# EasyEDA Pro project 物联网底板.eprj, board PCB1
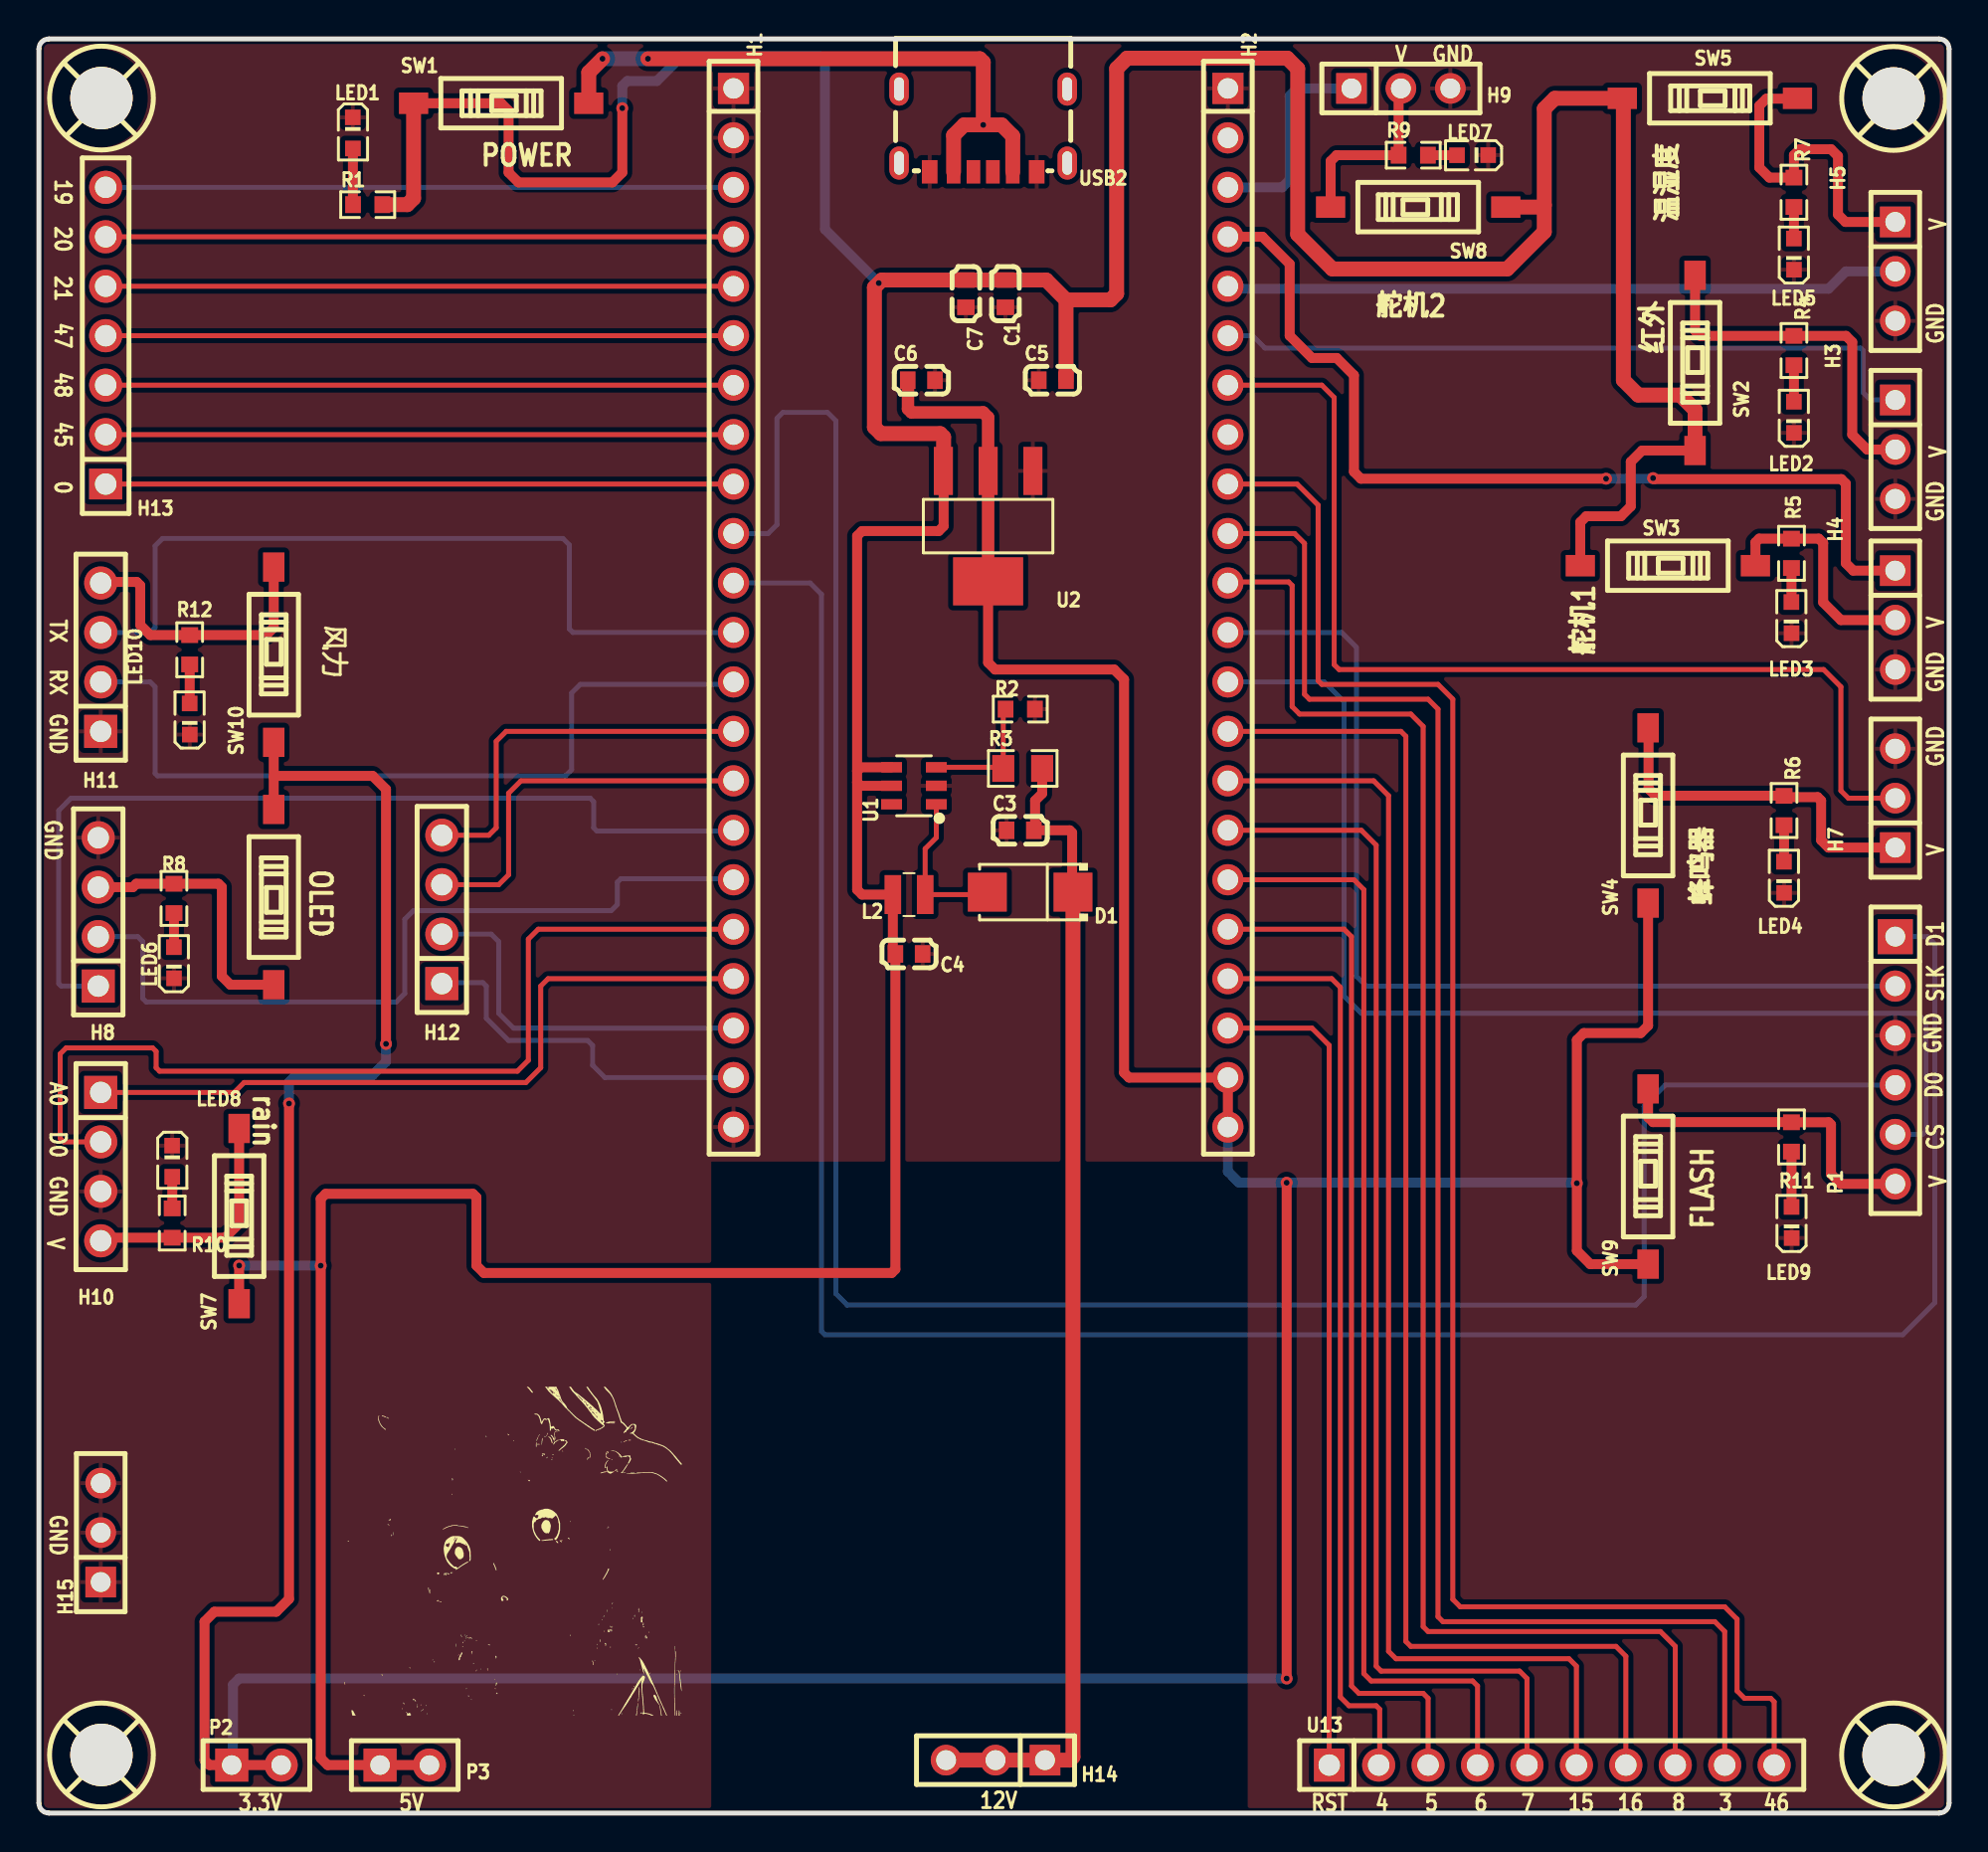
[diagram p2: board, top side]
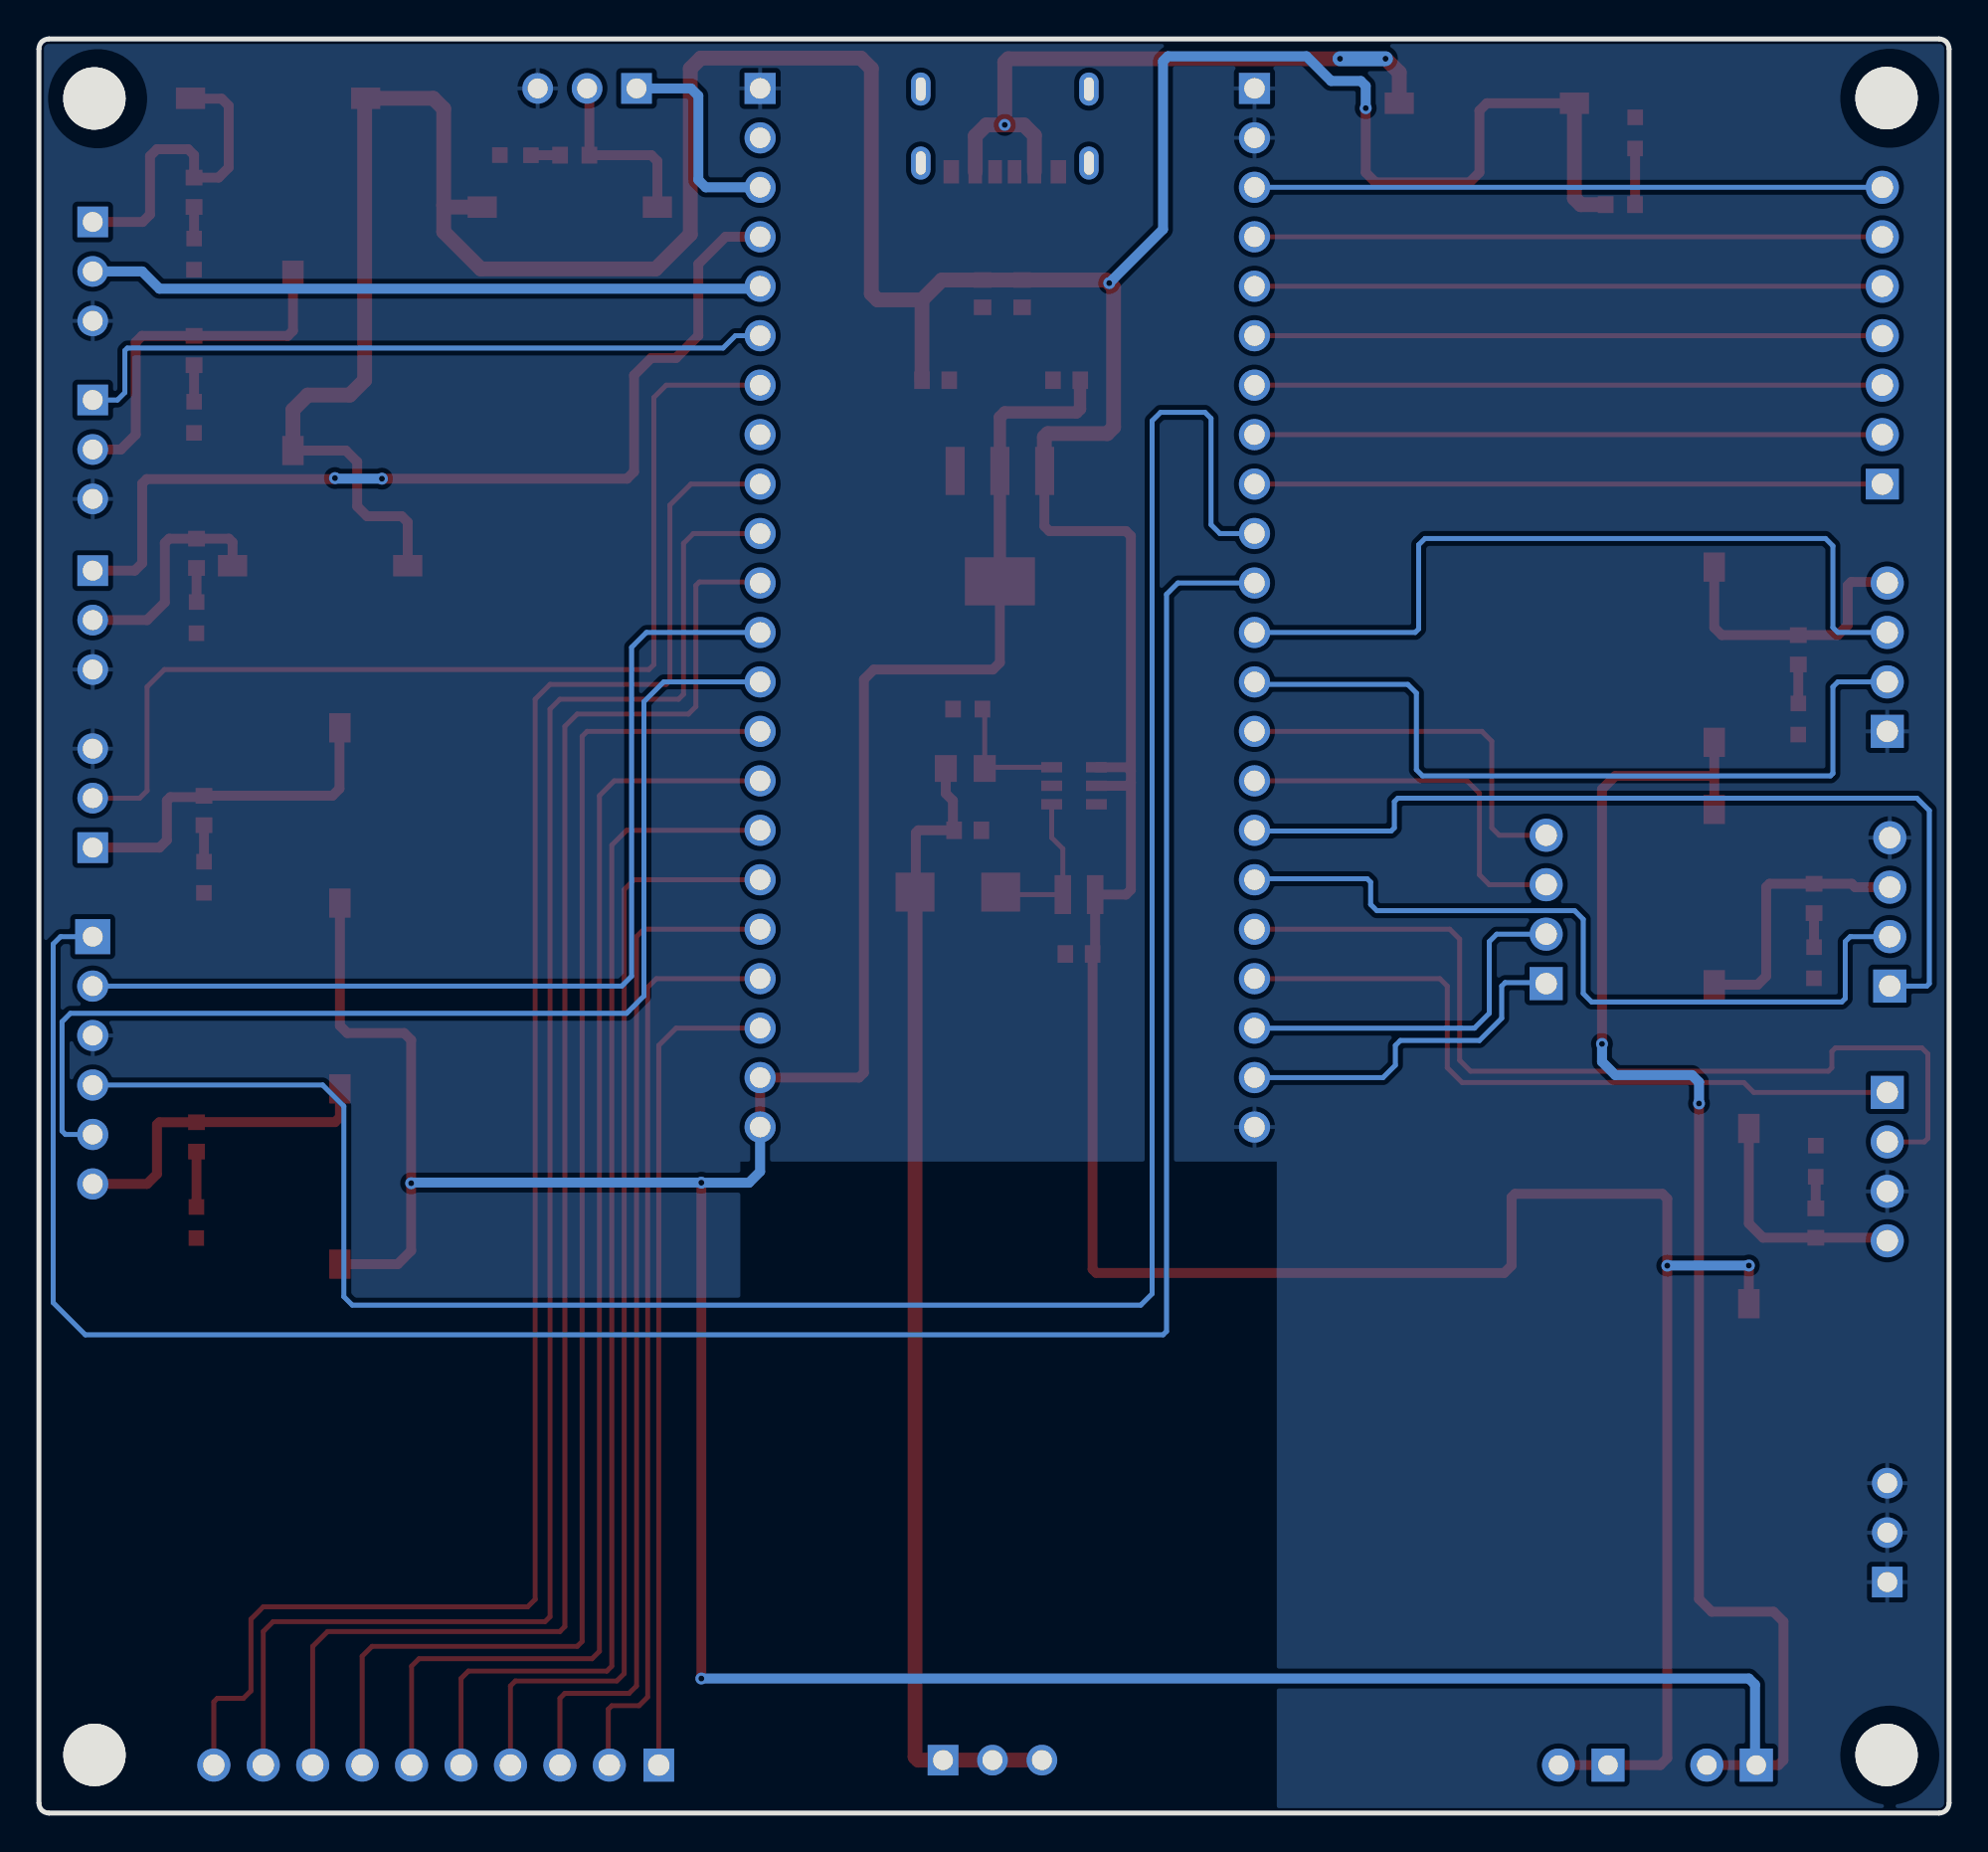
[diagram p3: board, bottom side, seen from below]

Outline 98.14 x 91.11 mm; copper layers: Top Layer, Bottom Layer. Coordinates in mm from the lower left corner of the outline.
Outline path: 0,90.6 0,0.51 arc(0.15,0.15) 0.51,0 97.63,0 arc(97.99,0.15) 98.14,0.51 98.14,90.6 arc(97.99,90.96) 97.63,91.11 0.51,91.11 arc(0.15,90.96) 0,90.6
Stack: Top Layer 0.035mm / Dielectric1 1.51mm FR4 er 4.5 / Bottom Layer 0.035mm

## Design rules (mm)
net D0_F: DP2
net D1_F: DP2
net TX: DP1
net RX: DP1
template: JLCPCB Capability(Two Layers Board)
spacing copperThickness1oz (default): track to track 0.102, other pairs 0.152 to 0.3
spacing copperThickness2oz: track to track 0.203, other pairs 0.152 to 0.3
track width copperThickness1oz (default): min 0.127, default 0.254, max 2.54
track width copperThickness2oz: min 0.203, default 0.254, max 2.54
differential pair differentialPair (default): width min 0.127, default 0.254, max 2.54; gap min 0.152, default 0.152
via viaSize (default): diameter min 0.5, default 0.61, max 10; hole min 0.3, default 0.305, max 6.3

## Placement (name value [footprint] x y rotation side)
C1  100nF  [C0603]  49.66 78.03 90 top
C3  22uF  [C0603]  50.42 50.47 0 top
C4  22uF  [C0603]  44.7 44.12 180 top
C5  10uF  [C0603]  52.07 73.58 0 top
C6  10uF  [C0603]  45.34 73.58 0 top
C7  22uF  [C0603]  47.63 78.03 90 top
D1  SS34  [SMA_L4.3-W2.6-LS5.2-RD]  50.93 47.3 180 top
H1  CS-1165SDIG-1*22  [HDR-TH_22P-P2.54-V-F]  35.69 61.9 270 top
H2  CS-1165SDIG-1*22  [HDR-TH_22P-P2.54-V-F]  61.09 61.9 270 top
H2#2  -  [M3]  3.05 88.06 0 top
H2#3  -  [M3]  95.13 88.04 0 top
H2#4  -  [M3]  95.12 2.97 0 top
H2#5  -  [M3]  3.05 2.97 0 top
H3  红外  [HDR-TH_3P-P2.54-V-F]  95.38 70.03 270 top
H4  舵机  [HDR-TH_3P-P2.54-V-F]  95.38 61.27 270 top
H5  DHT11  [HDR-TH_3P-P2.54-V-F]  95.38 79.17 270 top
H7  蜂鸣器  [HDR-TH_3P-P2.54-V-F]  95.38 52.12 90 top
H8  OLED  [HDR-TH_4P-P2.54-V-F]  3.05 46.28 90 top
H9  舵机2  [HDR-TH_3P-P2.54-V-F]  69.98 88.57 0 top
H10  rain  [HDR-TH_4P-P2.54-V-F]  3.18 33.2 270 top
H11  WIND  [HDR-TH_4P-P2.54-V-F]  3.18 59.36 90 top
H12  2.54-1*4P母  [HDR-TH_4P-P2.54-V-F]  20.7 46.41 90 top
H13  PM254V-11-07-H85  [HDR-TH_7P-P2.54-V-F]  3.43 75.87 90 top
H14  PM254V-11-03-H85  [HDR-TH_3P-P2.54-V-F]  49.15 2.72 180 top
H15  PM254V-11-03-H85  [HDR-TH_3P-P2.54-V-F]  3.18 14.4 90 top
L2  4.7uH  [IND-SMD_L2.5-W2.0-VLS252012CX-150M]  44.7 47.17 180 top
LED1  XL-1608UGC-04  [LED0603-RD_GREEN]  16.13 86.28 270 top
LED2  XL-1608UGC-04  [LED0603-RD_GREEN]  90.17 71.68 90 top
LED3  XL-1608UGC-04  [LED0603-RD_GREEN]  90.04 61.39 90 top
LED4  XL-1608UGC-04  [LED0603-RD_GREEN]  89.66 48.06 90 top
LED5  XL-1608UGC-04  [LED0603-RD_GREEN]  90.17 80.06 90 top
LED6  XL-1608UGC-04  [LED0603-RD_GREEN]  6.94 43.67 90 top
LED7  XL-1608UGC-04  [LED0603-RD_GREEN]  73.66 85.14 180 top
LED8  XL-1608UGC-04  [LED0603-RD_GREEN]  6.85 33.48 270 top
LED9  XL-1608UGC-04  [LED0603-RD_GREEN]  90.05 30.33 90 top
LED10  XL-1608UGC-04  [LED0603-RD_GREEN]  7.75 56.19 90 top
P1  FLASH  [HDR-TH_6P-P2.54-V-F]  95.38 38.66 270 top
P2  2.54-1*2P母  [HDR-TH_2P-P2.54-V-F]  11.18 2.46 0 top
P3  2.54-1*2P母  [HDR-TH_2P-P2.54-V-F]  18.8 2.46 0 top
R1  1kΩ  [R0603]  16.89 82.6 0 top
R2  1kΩ  [R0603]  50.42 56.69 180 top
R3  19kΩ  [R0805]  50.55 53.65 0 top
R4  1kΩ  [R0603]  90.17 75.11 270 top
R5  1kΩ  [R0603]  90.04 64.69 270 top
R6  1kΩ  [R0603]  89.66 51.49 270 top
R7  1kΩ  [R0603]  90.17 83.24 270 top
R8  1kΩ  [R0603]  6.94 46.97 270 top
R9  1kΩ  [R0603]  70.61 85.14 0 top
R10  1kΩ  [R0603]  6.85 30.3 90 top
R11  1kΩ  [R0603]  90.04 34.72 90 top
R12  1kΩ  [R0603]  7.75 59.74 270 top
SW1  DSIC01LS-P  [SW-SMD_2P-L3.5-W6.1-P2.54-LS9.8]  23.75 87.81 0 top
SW2  DSIC01LS-P  [SW-SMD_2P-L3.5-W6.1-P2.54-LS9.8]  85.09 74.47 90 top
SW3  DSIC01LS-P  [SW-SMD_2P-L3.5-W6.1-P2.54-LS9.8]  83.69 64.06 0 top
SW4  DSIC01LS-P  [SW-SMD_2P-L3.5-W6.1-P2.54-LS9.8]  82.68 51.23 90 top
SW5  DSIC01LS-P  [SW-SMD_2P-L3.5-W6.1-P2.54-LS9.8]  85.85 88.06 0 top
SW6  DSIC01LS-P  [SW-SMD_2P-L3.5-W6.1-P2.54-LS9.8]  12.07 47.04 270 top
SW7  DSIC01LS-P  [SW-SMD_2P-L3.5-W6.1-P2.54-LS9.8]  10.29 30.66 90 top
SW8  DSIC01LS-P  [SW-SMD_2P-L3.5-W6.1-P2.54-LS9.8]  70.87 82.47 180 top
SW9  DSIC01LS-P  [SW-SMD_2P-L3.5-W6.1-P2.54-LS9.8]  82.68 32.69 90 top
SW10  DSIC01LS-P  [SW-SMD_2P-L3.5-W6.1-P2.54-LS9.8]  12.07 59.49 90 top
U1  MT3608  [SOT-23-6_L2.9-W1.6-P0.95-LS2.8-BL]  44.96 52.76 90 top
U2  AMS1117-3.3V  [SOT-223-4_L6.5-W3.5-P2.30-LS7.0-TR]  48.77 66.09 180 top
U13  PM254-1-10-Z-8.5  [HDR-TH_10P-P2.54-V-F]  77.72 2.46 0 top
USB2  TYPE-C 6P(073)  [TYPE-C-SMD_TYPE-C-6P-073]  48.51 86.41 180 top

## Footprints (pads in the part's own frame, mm; a bottom-side part is the same pattern mirrored in y, then rotated)
C0603
  rect 0.8x0.9 smd: 1(-0.7,0) 2(0.7,0)
HDR-TH_2P-P2.54-V-F
  rect 1.7x1.7 hole 1: 1(-1.27,0)
  round 1.7 hole 1: 2(1.27,0)
HDR-TH_3P-P2.54-V-F
  rect 1.575x1.575 hole 1.02: 1(-2.54,0)
  round 1.575 hole 1.02: 2(0,0) 3(2.54,0)
HDR-TH_4P-P2.54-V-F
  rect 1.7x1.7 hole 1.1: 1(-3.81,0)
  round 1.7 hole 1.1: 2(-1.27,0) 3(1.27,0) 4(3.81,0)
HDR-TH_6P-P2.54-V-F
  rect 1.8x1.8 hole 1.02: 1(-6.35,0)
  round 1.6 hole 1.02: 2(-3.81,0) 3(-1.27,0) 4(1.27,0) 5(3.81,0) 6(6.35,0)
HDR-TH_7P-P2.54-V-F
  rect 1.575x1.7 hole 1.1: 1(-7.62,0)
  round 1.7 hole 1.1: 2(-5.08,0) 3(-2.54,0) 4(0,0) 5(2.54,0) 6(5.08,0) 7(7.62,0)
HDR-TH_10P-P2.54-V-F
  rect 1.575x1.7 hole 1.1: 1(-11.43,0)
  round 1.7 hole 1.1: 2(-8.89,0) 3(-6.35,0) 4(-3.81,0) 5(-1.27,0) 6(1.27,0) 7(3.81,0) 8(6.35,0) 9(8.89,0) 10(11.43,0)
HDR-TH_22P-P2.54-V-F
  rect 1.6x1.6 hole 1.05: 1(-26.67,0)
  round 1.6 hole 1.05: 2(-24.13,0) 3(-21.59,0) 4(-19.05,0) 5(-16.51,0) 6(-13.97,0) 7(-11.43,0) 8(-8.89,0) 9(-6.35,0) 10(-3.81,0) 11(-1.27,0) 12(1.27,0) 13(3.81,0) 14(6.35,0) 15(8.89,0) 16(11.43,0) 17(13.97,0) 18(16.51,0) 19(19.05,0) 20(21.59,0) 21(24.13,0) 22(26.67,0)
IND-SMD_L2.5-W2.0-VLS252012CX-150M
  rect 0.85x2 smd: 1(-0.83,0) 2(0.83,0)
LED0603-RD_GREEN
  rect 0.8x0.8 smd: 1(-0.799,-0.004) 2(0.799,0.004)
M3
  round 3.2 hole 3.2: 0(0.165,0.013)
R0603
  rect 0.806x0.864 smd: 1(-0.753,0) 2(0.753,0)
R0805
  rect 1.133x1.377 smd: 1(-1,0) 2(1,0)
SMA_L4.3-W2.6-LS5.2-RD
  rect 2x2 smd: 1(-2.2,0) 2(2.2,0)
SOT-23-6_L2.9-W1.6-P0.95-LS2.8-BL
  rect 0.532x1.072 smd: 1(-0.95,-1.149) 2(0,-1.149) 3(0.95,-1.149) 4(0.95,1.149) 5(0,1.149) 6(-0.95,1.149)
SOT-223-4_L6.5-W3.5-P2.30-LS7.0-TR
  rect 0.98x2.47 smd: 1(-2.3,-2.835) 2(0,-2.835) 3(2.3,-2.835)
  rect 3.6x2.47 smd: 4(0,2.835)
SW-SMD_2P-L3.5-W6.1-P2.54-LS9.8
  rect 1.5x1.1 smd: 1(-4.5,0) 2(4.5,0)
TYPE-C-SMD_TYPE-C-6P-073
  oval 1x1.7 hole 0.5x1.2: 7(-4.32,1.675) 7(-4.32,-2.125) 7(4.32,1.675) 7(4.32,-2.125)
  rect 0.7x1.2 smd: A5(-0.5,2.125) A9(1.52,2.125) B5(0.5,2.125) B9(-1.52,2.125)
  rect 0.8x1.2 smd: A12(2.75,2.125) B12(-2.75,2.125)

## Nets
As in the schematic.

Pads without a net: H2 2; H2#2 0; H2#3 0; H2#4 0; H2#5 0; U1 6; USB2 7 A5 B5

## Via types
v1: diameter 0.61, hole 0.305, Top Layer to Bottom Layer, 14 vias

## Routing (per net, layer and track width the routed paths; a pad name or vN(x,y) marks a point on that pad's centre or on a via; arc(x,y) is an arc through that point)
3.3V: length 254.7
  Top Layer w0.508: 12.45,2.46 P2.1 8.76,2.46 8.51,2.72 8.51,9.83 9.02,10.34 12.19,10.34 12.85,11 v1(12.85,36.44) ; SW9.1 79.71,28.19 79.02,28.88 v1(79.02,32.35) 79.02,39.7 79.38,40.06 82.3,40.06 82.68,40.44 SW4.1 ; 12.06,53.2 12.13,53.26 17.15,53.26 17.83,52.58 v1(17.83,39.5) ; 12.06,53.2 12.06,54.99 ; 12.06,53.2 12.06,51.54 ; H2.22 H2.21 56.01,37.77 55.75,38.02 55.75,58.22 55.25,58.73 49.13,58.73 48.77,59.08 U2.4 ; v1(64.11,32.37) v1(64.11,6.91)
  Top Layer w0.635: C6.1 44.65,73.57 44.65,72.11 44.83,71.93 48.51,71.93 48.77,71.68 U2.2 U2.4
  Bottom Layer w0.508: H2.22 61.09,32.94 61.66,32.37 v1(64.11,32.37) 64.11,32.38 78.99,32.38 78.99,32.37 ; v1(12.85,36.44) 12.85,37.54 13.21,37.9 17.15,37.9 17.83,38.58 v1(17.83,39.5) ; v1(64.11,6.91) 10.29,6.91 9.97,6.59 9.97,2.53 P2.1
5V: length 32.6
  Top Layer w0.762: v1(28.96,90.09) 28.25,89.39 SW1.2 ; USB2.B9 50.03,86.12 49.46,86.7 v1(48.52,86.7) ; 46.99,84.29 46.99,86.16 47.53,86.7 v1(48.52,86.7) ; v1(31.29,90.09) 48.34,90.09 48.52,89.91 v1(48.52,86.7)
  Bottom Layer w0.762: v1(31.29,90.09) v1(28.96,90.09)
12V: length 59.4
  Top Layer w0.508: R3.2 51.55,52.36 51.18,51.99 51.18,50.53 C3.2 52.96,50.47 53.09,50.34 53.09,47.34 D1.1
  Top Layer w0.762: H14.3 H14.2 H14.1 52.96,2.72 53.13,2.89 D1.1
VIN: length 292.1
  Top Layer w0.508: v1(29.97,87.55) 29.97,84.25 29.46,83.74 24.64,83.74 24.13,84.25 24.13,87.43 23.75,87.81 SW1.1 ; 42.04,52.94 42.22,52.76 U1.5 ; 42.04,52.94 42.04,53.52 ; 42.04,52.94 42.04,47.42 42.29,47.17 43.87,47.17 43.87,44.38 ; 44.07,44.18 44.13,44.12 ; 42.04,53.52 42.23,53.71 U1.4 ; 42.04,53.52 42.04,65.58 42.29,65.84 46.23,65.84 46.48,66.09 46.48,68.91 U2.3 ; SW7.1 v1(10.29,28.12) ; SW2.1 82.37,69.97 81.79,69.39 81.79,67.11 81.28,66.6 79.5,66.6 79.19,66.29 SW3.1 ; P3.2 P3.1 14.84,2.46 14.48,2.82 v1(14.48,28.11) 14.48,31.55 14.73,31.8 22.3,31.8 22.48,31.62 22.48,28.12 22.86,27.74 43.82,27.74 44,27.93 C4.2
  Top Layer w0.762: 77.34,82.57 77.24,82.47 SW8.1 ; 77.34,82.57 77.34,87.52 77.88,88.06 SW5.1 81.41,88.01 81.41,73.58 82.17,72.82 84.33,72.82 85.09,72.06 SW2.1 ; 77.34,82.57 77.34,81.2 75.44,79.3 66.45,79.3 64.67,81.08 64.67,89.59 64.14,90.12 55.91,90.12 55.37,89.59 55.37,78.03 55.05,77.71 52.77,77.71 ; R1.2 18.92,82.6 19.25,82.93 SW1.1 ; C5.2 52.77,77.71 ; 52.77,77.71 51.75,78.73 C1.2 C7.2 43.31,78.73 42.93,78.35 42.93,71.17 43.25,70.84 46.3,70.84 46.48,70.66 46.48,68.94 U2.3
  Bottom Layer w0.508: v1(10.29,28.12) 14.47,28.12 v1(14.48,28.11) ; v1(29.97,87.55) 29.97,88.7 30.23,88.95 31.75,88.95 33.02,90.22 40.13,90.22 40.39,89.97 40.39,81.33 v1(43.15,78.57)
A0_RAIN: length 37.4
  Top Layer w0.254: H1.19 26.16,42.85 25.78,42.47 25.78,38.28 25.02,37.52 10.54,37.52 10.03,37.01 H10.1
BEEP: length 54.2
  Top Layer w0.254: H7.2 92.96,52.12 92.58,52.5 92.58,57.84 91.69,58.73 66.8,58.73 66.55,58.98 66.55,72.7 65.91,73.33 H2.7
CS_F: length 59.2
  Bottom Layer w0.254: P1.5 96.77,34.85 96.95,35.03 96.95,40.64 96.52,41.07 67.95,41.07 67.06,41.96 67.06,57.07 66.04,58.09 H2.13
D0_F: length 121.1
  Bottom Layer w0.254: P1.4 83.57,37.39 82.48,36.3 82.48,26.52 82.04,26.09 41.53,26.09 40.95,26.67 40.95,71.5 40.51,71.93 38.23,71.93 37.92,71.63 37.92,66.17 37.47,65.71 H1.10
D1_F: length 121.2
  Bottom Layer w0.254: H1.11 39.62,63.17 40.21,62.59 40.21,24.74 40.39,24.56 95.76,24.56 97.41,26.21 97.41,44.63 97.03,45.01 P1.1
DO_RAIN: length 48.9
  Top Layer w0.254: H10.2 1.27,34.47 1.09,34.65 1.09,38.99 1.4,39.29 5.84,39.29 6.02,39.11 6.02,38.28 6.2,38.1 24.59,38.1 25.15,38.66 25.15,44.88 25.65,45.39 H1.18
PWM_1: length 48.9
  Top Layer w0.508: v1(80.52,68.53) 67.92,68.53 67.56,68.89 67.56,73.84 66.67,74.73 65.41,74.73 64.26,75.87 64.26,79.55 62.86,80.95 H2.4 ; H4.1 93.22,63.81 92.84,64.19 92.84,68.27 92.61,68.5 82.98,68.5 v1(82.93,68.56)
  Bottom Layer w0.508: v1(80.52,68.53) 82.9,68.53 v1(82.93,68.56)
PWM_2: length 11
  Bottom Layer w0.508: H9.1 64.64,88.57 64.26,88.19 64.26,83.87 63.88,83.49 H2.3
RED_DATA: length 36.9
  Bottom Layer w0.254: H2.6 62.36,75.87 62.99,75.24 93.6,75.24 93.73,75.11 93.73,72.95 94.11,72.57 H3.1
RX: length 41.4
  Bottom Layer w0.254: H11.2 5.72,58.09 5.97,57.84 5.97,53.39 6.1,53.26 27.05,53.26 27.37,53.58 27.37,57.52 27.81,57.96 35.56,57.96 H1.13
SCK: length 41.3
  Bottom Layer w0.254: 3.05,45.01 5.08,45.01 5.33,44.76 5.33,41.83 5.51,41.65 18.36,41.65 18.8,42.09 18.8,45.9 19.24,46.34 29.4,46.34 29.72,46.66 29.72,47.8 29.9,47.98 35.63,47.98 H1.17
SDA: length 47.4
  Bottom Layer w0.254: H8.1 1.14,42.47 1.02,42.6 1.02,51.49 1.65,52.12 28.32,52.12 28.5,51.94 28.5,50.6 28.67,50.43 35.65,50.43 H1.16
SLK_F: length 51.7
  Bottom Layer w0.254: P1.2 68.2,42.47 67.69,42.98 67.69,59.87 66.93,60.63 H2.12
TEMP_DATA: length 34.7
  Bottom Layer w0.508: H5.2 92.84,79.17 91.95,78.28 61.21,78.28 H2.5
TX: length 41.5
  Bottom Layer w0.254: H11.3 5.72,60.63 5.97,60.88 5.97,65.08 6.35,65.46 26.92,65.46 27.25,65.13 27.25,60.81 27.43,60.63 H1.12
$1N2366: length 2.9
  Top Layer w0.508: LED1.2 16.13,82.61 R1.1
$1N3012: length 6.6
  Top Layer w0.254: U1.3 49.48,53.71 R3.1 49.55,56.57 R2.2
$1N3021: length 8.1
  Top Layer w0.254: U1.1 46.11,50.1 45.53,49.52 L2.1 48.6,47.17 D1.2
$1N5411: length 91.7
  Top Layer w0.254: H2.9 64.64,68.25 65.72,67.17 65.72,58.15 65.91,57.96 71.88,57.96 72.64,57.2 72.64,10.97 73.03,10.59 86.61,10.59 87.25,9.96 87.25,6.27 87.63,5.89 88.97,5.89 89.15,5.71 U13.10
$1N5418: length 87.6
  Top Layer w0.254: 86.61,2.46 86.61,9.32 86.11,9.83 72.14,9.83 71.88,10.08 71.88,56.69 71.37,57.2 65.28,57.2 65.02,57.46 65.02,65.2 64.52,65.71 H2.10
$1N5441: length 82.5
  Top Layer w0.254: H2.11 61.14,63.22 64.21,63.22 64.39,63.04 64.39,56.82 64.77,56.44 70.48,56.44 71.12,55.8 71.12,9.58 71.37,9.32 83.31,9.32 84.07,8.56 U13.8
$1N5447: length 72.9
  Top Layer w0.254: H2.14 69.98,55.55 70.23,55.3 70.23,8.81 70.48,8.56 81.03,8.56 81.53,8.05 U13.7
$1N5454: length 67.6
  Top Layer w0.254: U13.6 78.99,7.54 78.61,7.93 69.72,7.93 69.34,8.31 69.34,52.25 68.58,53.01 H2.15
$1N5462: length 62.6
  Top Layer w0.254: U13.5 76.45,6.91 76.07,7.29 68.96,7.29 68.71,7.54 68.71,49.71 67.95,50.47 H2.16
$1N5471: length 57.6
  Top Layer w0.254: H2.17 67.56,47.93 68.07,47.42 68.07,7.16 68.45,6.78 73.66,6.78 73.91,6.53 U13.4
$1N5478: length 52.6
  Top Layer w0.254: U13.3 71.37,5.89 71.12,6.15 67.82,6.15 67.44,6.53 67.44,45.01 67.06,45.39 H2.18
$1N5485: length 47.6
  Top Layer w0.254: H2.19 66.42,42.85 66.87,42.41 66.87,5.96 67.31,5.51 68.71,5.51 68.89,5.33 68.89,2.52 U13.2
$1N5495: length 42.5
  Top Layer w0.254: U13.1 66.29,39.42 65.41,40.31 H2.20
$1N5602: length 19.8
  Top Layer w0.254: H12.4 23.11,50.22 23.5,50.6 23.5,55.04 24,55.55 H1.14
$1N5611: length 19.7
  Top Layer w0.254: H12.3 23.62,47.68 24.13,48.18 24.13,52.38 24.77,53.01 H1.15
$1N5621: length 19.1
  Bottom Layer w0.254: H12.2 23.24,45.14 23.62,44.76 23.62,41.07 24.38,40.31 H1.20
$1N5630: length 18.6
  Bottom Layer w0.254: H12.1 20.75,42.65 22.81,42.65 22.99,42.47 22.99,40.82 24.13,39.68 28.19,39.68 28.45,39.42 28.45,38.41 29.08,37.77 H1.21
$1N5755: length 32.3
  Top Layer w0.254: H13.1 H1.9
$1N5763: length 32.3
  Top Layer w0.254: H13.2 H1.8
$1N5773: length 32.3
  Top Layer w0.254: H13.3 H1.7
$1N5780: length 32.3
  Top Layer w0.254: H13.4 H1.6
$1N5790: length 32.3
  Top Layer w0.254: H13.5 H1.5
$1N5797: length 32.3
  Top Layer w0.254: H13.6 H1.4
$1N5807: length 32.3
  Bottom Layer w0.254: H1.3 H13.7
$1N5861: length 18.4
  Top Layer w0.508: SW2.2 85.09,76.12 85.35,75.86 R4.1 92.85,75.86 93.17,75.54 93.17,70.79 93.93,70.03 H3.2
$1N5982: length 1.9
  Top Layer w0.508: LED2.2 90.17,72.48 R4.2
$1N6009: length 12
  Top Layer w0.508: SW3.2 88.19,65.26 88.38,65.45 R5.1 91.45,65.45 91.67,65.22 91.67,62.18 92.58,61.27 H4.2
$1N6135: length 1.8
  Top Layer w0.508: R5.2 90.04,62.2 LED3.2
$1N6161: length 18.2
  Top Layer w0.508: H7.1 91.95,49.58 91.57,49.96 91.57,51.99 91.39,52.17 89.73,52.17 ; SW4.2 82.7,55.71 82.7,52.61 83.06,52.25 89.65,52.25 R6.1
$1N6286: length 1.9
  Top Layer w0.508: R6.2 89.66,48.86 LED4.2
$1N6410: length 17.1
  Top Layer w0.508: H5.1 92.82,81.71 92.43,82.09 92.43,85.09 92.08,85.45 90.48,85.45 90.17,85.14 R7.1 88.91,83.99 88.39,84.51 88.39,87.68 88.75,88.04 90.33,88.04 SW5.2
$1N6420: length 1.6
  Top Layer w0.508: R7.2 90.17,80.86 LED5.2
$1N6506: length 13.9
  Top Layer w0.508: H8.3 4.83,47.55 5,47.72 R8.1 9.22,47.72 9.4,47.55 9.4,42.98 9.83,42.54 SW6.2
$1N6599: length 1.8
  Top Layer w0.508: R8.2 6.94,44.47 LED6.2
$1N6654: length 9.5
  Top Layer w0.508: H9.2 69.86,88.45 R9.1 66.67,85.14 66.37,84.83 SW8.2
$1N6806: length 1.5
  Top Layer w0.508: LED7.2 72.86,85.14 R9.2
$1N6820: length 12.4
  Top Layer w0.508: H10.4 3.33,29.55 R10.1 9.56,29.55 10.29,30.28 SW7.2
$1N6926: length 1.6
  Top Layer w0.508: LED8.2 6.85,31.06 R10.2
$1N6986: length 17.1
  Top Layer w0.508: SW9.2 82.68,35.74 82.93,35.48 90.03,35.48 R11.2 91.96,35.48 92.08,35.36 92.08,32.82 92.58,32.31 P1.6
$1N7140: length 14.5
  Top Layer w0.508: H11.4 3.23,63.22 5.03,63.22 5.21,63.04 5.21,61.01 5.72,60.49 R12.1 11.68,60.49 12.07,60.88 SW10.2
$1N7229: length 2
  Top Layer w0.508: R12.2 7.75,56.99 LED10.2
$1N16149: length 2.8
  Top Layer w0.508: R11.1 90.05,33.97 LED9.2

## Copper pours and planes (outline as drawn; the poured copper is in the pictures)
GND on Top Layer: -1.02,91.75 98.81,91.75 98.81,-0.97 -1.02,-0.97
GND on Bottom Layer: -0.79,91.75 98.42,91.75 98.42,-0.97 -0.79,-0.97

## Text on the board
Top Silkscreen Layer: 3.3V | 5V | 12V | D0 | V | D1 | SLK | CS | GND | A0 | RST | 4 | 5 | 6 | 7 | 15 | 16 | 8 | 3 | 46 | TX | RX | 19 | 21 | 48 | 45 | 0 | 20 | 47 | POWER | FLASH | rain | OLED | 风力 | 舵机1 | 红外 | 温湿度 | 蜂鸣器 | 舵机2
